# Altium schematic sheet PowerBoardScheme.SchDoc
size A4
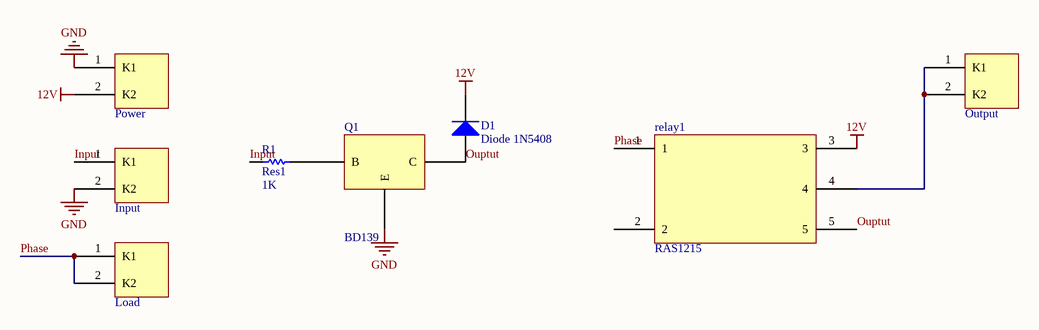
[diagram p0: PowerBoardScheme.SchDoc]

## Parts
D1  Diode 1N5408  [DO-201AD]
Input  Klema  [Klema]  (value not drawn)
Load  Klema  [Klema]  (value not drawn)
Output  Klema  [Klema]  (value not drawn)
Power  Klema  [Klema]  (value not drawn)
Q1  BD139  [BD139]
R1  Res1  value 1K  [AXIAL-0.3]
relay1  RAS1215  [RAS1215]

## Nets
12V: D1.2(K) Power.2(K2) relay1.3
GND: Input.2(K2) Power.1(K1) Q1.1(E)
Input: Input.1(K1) R1.1
Ouptut: D1.1(A) Q1.2(C) relay1.5
Phase: Load.1(K1) Load.2(K2) relay1.1
NetOutput_1: Output.1(K1) Output.2(K2) relay1.4
NetQ1_3: Q1.3(B) R1.2

Not connected (* = marked no-connect by the designer): relay1 2

## Library data of the parts
D1 = Diode 1N5408: 3 Amp Medium Power Silicon Rectifier Diode; Published: 8-Jun-2000; LatestRevisionDate: 17-Jul-2002; LatestRevisionNote: Re-released for DXP Platform.; DatasheetVersion: Aug-1984; PackageReference: DO-201AD; Publisher: Altium Limited; PackageDescription: Diode, Axial; Body 9.5 x 5.3 mm (LxDia. max), Lead Dia. 1.32 mm (max); ComponentLink1Description: Manufacturer Link; ComponentLink1URL: http://www.irf.com/
R1 = Res1: Resistor; Published: 8-Jun-2000; LatestRevisionDate: 17-Jul-2002; LatestRevisionNote: Re-released for DXP Platform.; PackageReference: AXIAL-0.3; Publisher: Altium Limited; PackageDescription: Axial Device, Thru-Hole; 2 Leads; 0.3 in Pin Spacing